# Altium schematic sheet ADCS_SENS.SchDoc
size A4; SheetNumber: 6; SheetTotal: 9
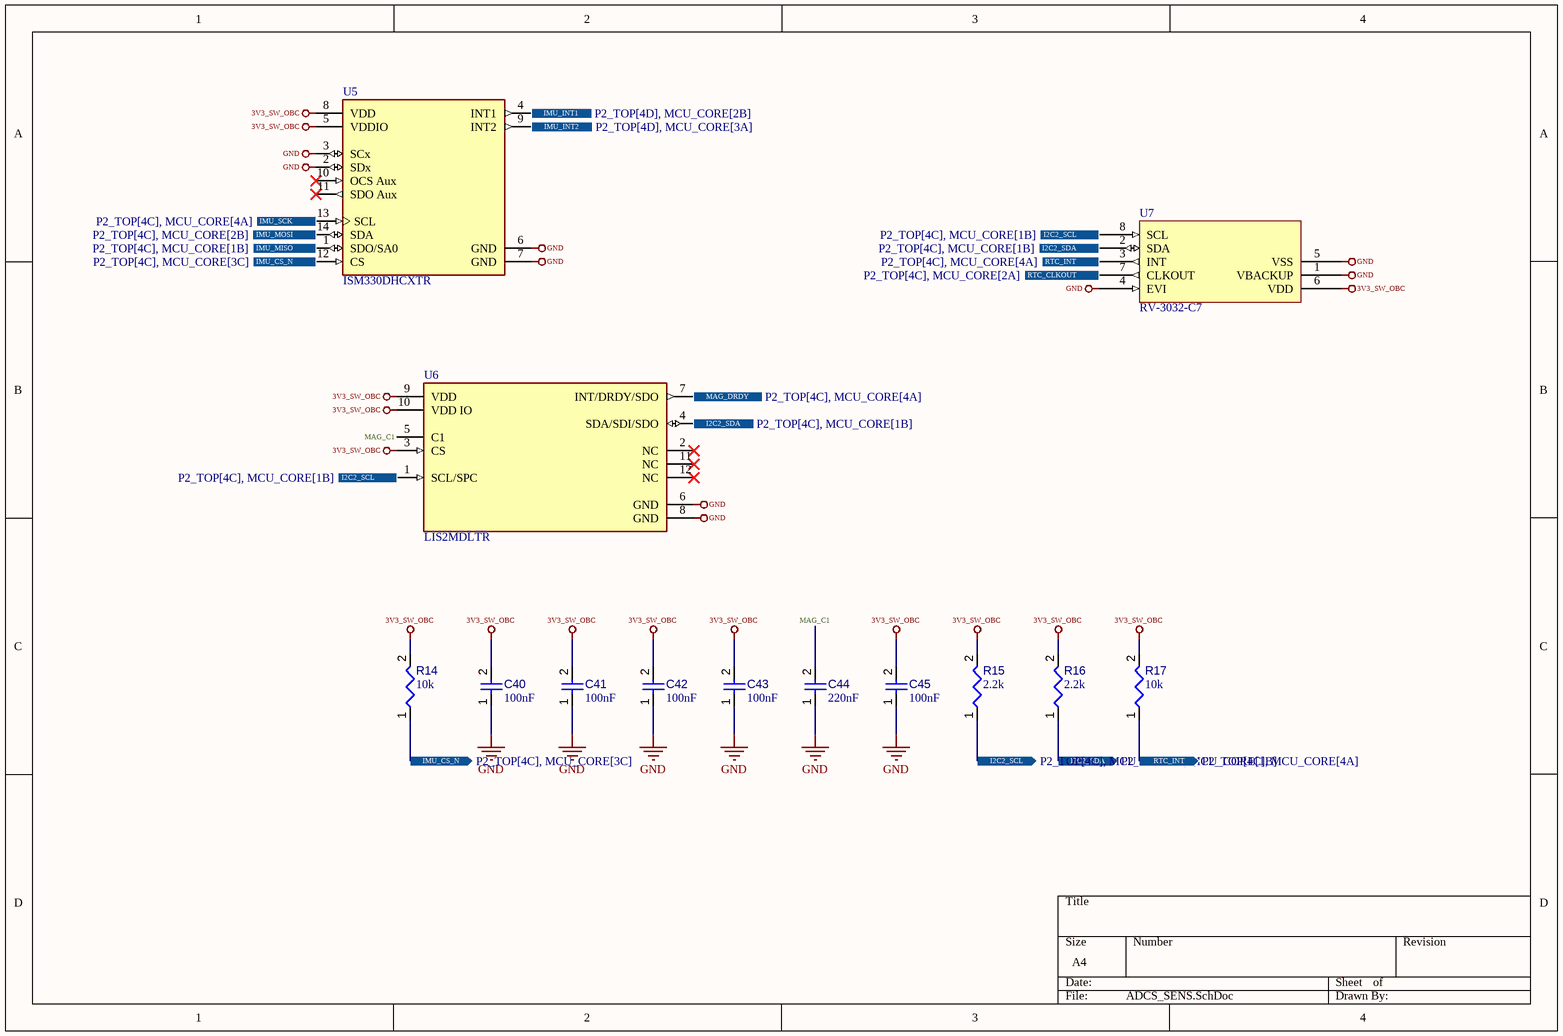
[diagram p0: ADCS_SENS.SchDoc]

## Parts
C40  value 100nF  [CAPC0402(1005)60_L]  (hidden comment: Capacitor 100nF +/-20% 10V 0402)
C41  value 100nF  [CAPC0402(1005)60_L]  (hidden comment: Capacitor 100nF +/-20% 10V 0402)
C42  value 100nF  [CAPC0402(1005)60_L]  (hidden comment: Capacitor 100nF +/-20% 10V 0402)
C43  value 100nF  [CAPC0402(1005)60_L]  (hidden comment: Capacitor 100nF +/-20% 10V 0402)
C44  value 220nF  [CAPC0402(1005)60_L]  (hidden comment: Capacitor 220nF +/-20% 10V 0402)
C45  value 100nF  [CAPC0402(1005)60_L]  (hidden comment: Capacitor 100nF +/-20% 10V 0402)
R14  value 10k  [RESC1005X40X25ML05T05]  (hidden comment: Resistor 10k +/-1% 0402 63 mW)
R15  value 2.2k  [RESC0402(1005)_L]  (hidden comment: Resistor 2K2  +/-5 % 0402 63 mW)
R16  value 2.2k  [RESC0402(1005)_L]  (hidden comment: Resistor 2K2  +/-5 % 0402 63 mW)
R17  value 10k  [RESC1005X40X25ML05T05]  (hidden comment: Resistor 10k +/-1% 0402 63 mW)
U5  ISM330DHCXTR  [FP-LGA-14L-DM00249496-MFG]
U6  LIS2MDLTR  [FP-LGA-12-DM00170568-MFG]
U7  RV-3032-C7  [RV-3032-C7-Footprint-1]

## Ports
I2C2_SCL (out, see P2_TOP[4C], MCU_CORE[1B]), I2C2_SDA (out, see P2_TOP[4C], MCU_CORE[1B]), IMU_CS_N (out, see P2_TOP[4C], MCU_CORE[3C]), IMU_INT1 (out, see P2_TOP[4D], MCU_CORE[2B]), IMU_INT2 (out, see P2_TOP[4D], MCU_CORE[3A]), IMU_MISO (out, see P2_TOP[4C], MCU_CORE[1B]), IMU_MOSI (out, see P2_TOP[4C], MCU_CORE[2B]), IMU_SCK (out, see P2_TOP[4C], MCU_CORE[4A]), MAG_DRDY (out, see P2_TOP[4C], MCU_CORE[4A]), RTC_CLKOUT (out, see P2_TOP[4C], MCU_CORE[2A]), RTC_INT (out, see P2_TOP[4C], MCU_CORE[4A])

## Nets
3V3_SW_OBC: C40.2 C41.2 C42.2 C43.2 C45.2 R14.2 R15.2 R16.2 R17.2 U5.5(VDDIO) U5.8(VDD) U6.3(CS) U6.9(VDD) U6.10(VDD_IO) U7.6(VDD)
GND: C40.1 C41.1 C42.1 C43.1 C44.1 C45.1 U5.2(SDx) U5.3(SCx) U5.6(GND) U5.7(GND) U6.6(GND) U6.8(GND) U7.1(VBACKUP) U7.4(EVI) U7.5(VSS)
I2C2_SCL: R15.1 U6.1(SCL/SPC) U7.8(SCL) ; port I2C2_SCL
I2C2_SDA: R16.1 U6.4(SDA/SDI/SDO) U7.2(SDA) ; port I2C2_SDA
IMU_CS_N: R14.1 U5.12(CS) ; port IMU_CS_N
IMU_INT1: U5.4(INT1) ; port IMU_INT1
IMU_INT2: U5.9(INT2) ; port IMU_INT2
IMU_MISO: U5.1(SDO/SA0) ; port IMU_MISO
IMU_MOSI: U5.14(SDA) ; port IMU_MOSI
IMU_SCK: U5.13(SCL) ; port IMU_SCK
MAG_C1: C44.2 U6.5(C1)
MAG_DRDY: U6.7(INT/DRDY/SDO) ; port MAG_DRDY
RTC_CLKOUT: U7.7(CLKOUT) ; port RTC_CLKOUT
RTC_INT: R17.1 U7.3(INT) ; port RTC_INT

Not connected (* = marked no-connect by the designer): U5 10(OCS_Aux)* 11(SDO_Aux)*; U6 2(NC)* 11(NC)* 12(NC)*

## Library data of the parts
C40-C43 C45 = CMP-001-00061-3: Chip Capacitor, 100nF +/-20%, 10V, 0402, Thickness 0.6 mm; Tolerance: 20%; Mounting Technology: SMT; Voltage Rating: 10V; Max Operating Temperature: 85°C; Pins: 2; Case/Package: 0402; Min Operating Temperature: -55°C
C44 = CMP-001-00057-3: Chip Capacitor, 220nF +/-20%, 10V, 0402, Thickness 0.6 mm; Tolerance: 10%; Max Operating Temperature: 85°C; Pins: 2; Case/Package: 0402; Mounting Technology: SMT; Voltage Rating: 10V; Min Operating Temperature: -55°C
R14 R17 = CMP-009-00019-5: Chip Resistor, 10 KOhm, +/- 1%, 63 mW, -55 to 155 degC, 0402 (1005 Metric); Power: 63mW; Voltage Rating: 50V; Case/Package: 0402; Mounting Technology: SM; Pins: 2; Min Operating Temperature: -55°C; Tolerance: 1%; RoHS Compliant: True; Max Operating Temperature: 155°C
R15 R16 = CMP-009-00166-3: Chip Resistor, 2,2 kOhms, +/-5 %, 63 mW, -55 to 155 degC, 0402; Power: 63mW; Tolerance: 5%; Pins: 2; Min Operating Temperature: -55°C; Max Operating Temperature: 155°C; Case/Package: 0402
U5 = CMP-010-00024-2: MEMS Module, Tri-Axis Gyroscope, Tri-Axis Accelerometer, 1.71 V, 3.6 V, LGA, 14 Pins; Output Configuration: Digital; Max Supply Voltage: 3.6V; Min Supply Voltage: 1.71V; Operating Supply Voltage: 1.8V; RoHS: Compliant; Lifecycle Status: Production; REACH SVHC: Unaffected; Output Type: Digital; Max Operating Temperature: 105°C; Min Operating Temperature: -40°C; Length: 3mm; Number of Terminals: 14; Country of Origin: Philippines; Mounting Technology: Surface Mount; China RoHS: Non-Compliant; Export Control Classification Number (ECCN) Code: EAR99; Height: 860µm; Introduction Date: 2019-07-31
U6 = CMP-010-00026-2: LIS2MDL Series 3.6V 50 Hz High Performance 3-Axis Digital Magnetic Sensor-LGA-12; Manufacturer Package Identifier: LGA-12-DM00170568; Axis: X, Y, Z; Operating Supply Voltage: 2.5V; Current Rating: 200µA; Min Supply Voltage: 1.71V; Min Operating Temperature: -40°C; Output Type: Digital; Max Supply Voltage: 3.6V; Country of Origin: Malta; Height: 700µm; Termination: Solder; Schedule B: 8542390000, 8542390000; Length: 2mm; Mounting Technology: Surface Mount; Export Control Classification Number (ECCN) Code: EAR99; Max Operating Temperature: 85°C; Introduction Date: 2017-05-12; China RoHS: Compliant; Sensing Method: Magnetic; Number of Terminals: 12; RoHS: Compliant; REACH SVHC: Unaffected; Lifecycle Status: Production
U7 = CMP-003-00032-2: Real Time Clock, Non-Volatile, 0 Timer(s), CMOS, CDSO8; Min Supply Voltage: 1.3V; Number of Timers/Counters: 0; Body Material: Ceramic; Nominal Supply Voltage (DC): 3V; Max Supply Voltage: 5.5V; Max Operating Temperature: 85°C; Length: 3.2mm; Height - Seated (Max): 800µm; Contact Plating: Gold; Lifecycle Status: Production; Ratings: AEC-Q200; China RoHS: Compliant; Terminal Pitch: 900µm; Width: 1.5mm; Number of Terminals: 8; RoHS: Compliant; REACH SVHC: Unaffected; Min Operating Temperature: -40°C